# Altium schematic sheet 18_HDMI_Connector.SchDoc
size A3; SheetNumber: 18; SheetTotal: 21
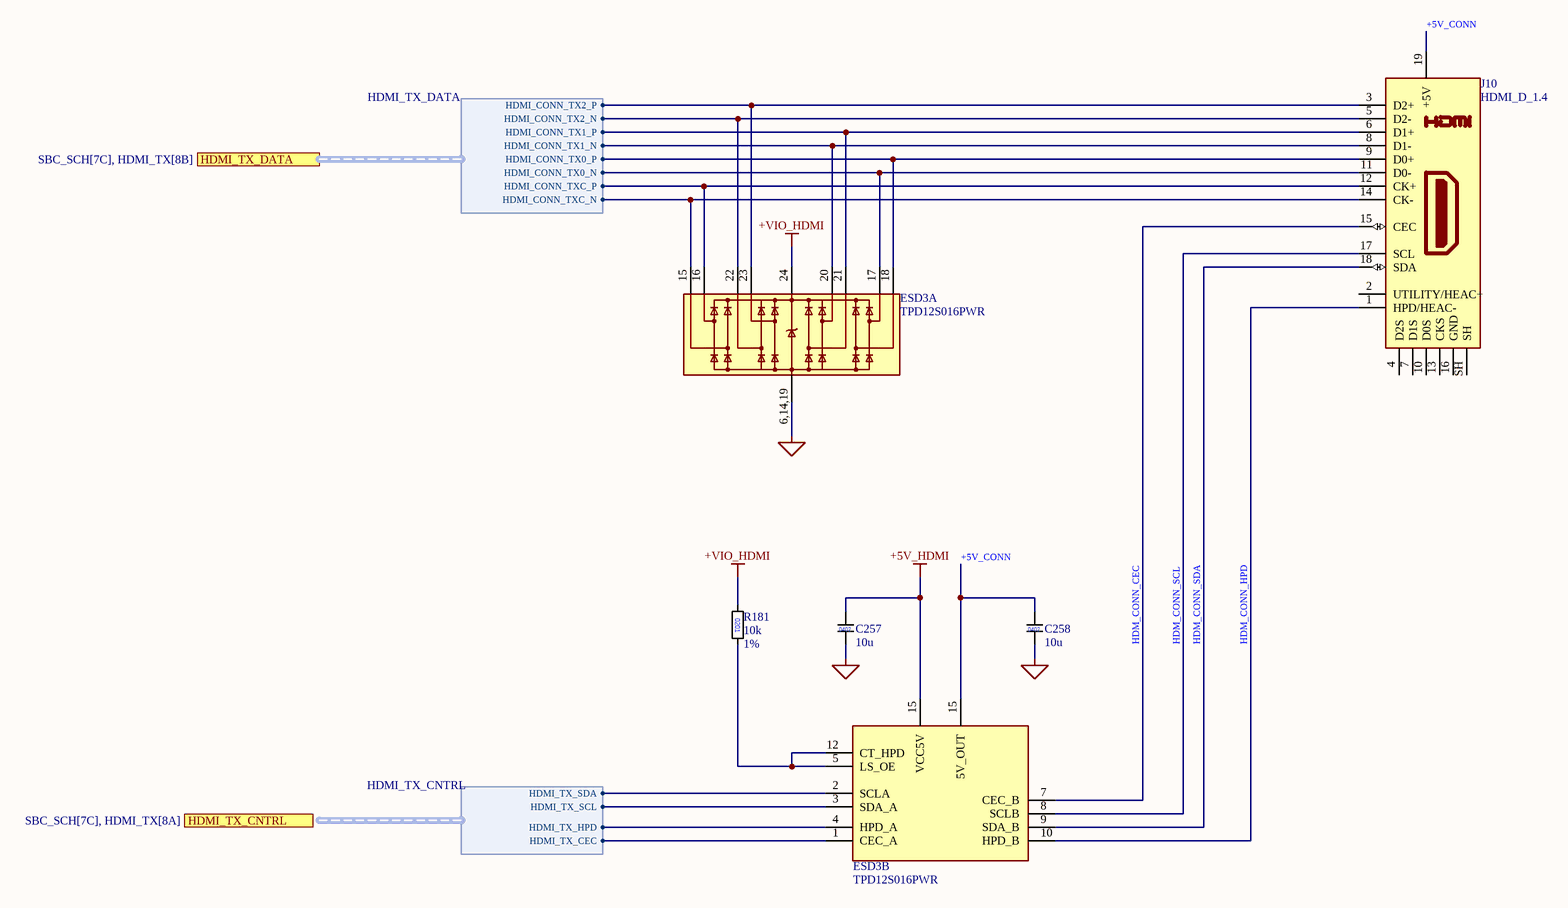
[diagram p0: 18_HDMI_Connector.SchDoc]

## Parts
C257  value 10u  [C0402]  (hidden comment: 4u7)
C258  value 10u  [C0402]  (hidden comment: 4u7)
ESD3  TPD12S016PWR  [TSOP65P640X120-24N]  (parts A,B of 2)
J10  HDMI_D_1.4  [HDMI_Micro-D_Molex_46765-1xxx]
R181  value 10k  Tolerance: 1%  [R0201]  (hidden comment: 0201)

## Ports
HDMI_TX_CNTRL (harness HDMI_TX_CNTRL, see SBC_SCH[7C], HDMI_TX[8A]), HDMI_TX_DATA (harness HDMI_TX_DATA, see SBC_SCH[7C], HDMI_TX[8B])

## Harnesses
HDMI_TX_DATA: HDMI_CONN_TXC_P, HDMI_CONN_TXC_N, HDMI_CONN_TX0_P, HDMI_CONN_TX0_N, HDMI_CONN_TX1_P, HDMI_CONN_TX1_N, HDMI_CONN_TX2_P, HDMI_CONN_TX2_N
HDMI_TX_CNTRL: HDMI_TX_SDA, HDMI_TX_SCL, HDMI_TX_HPD, HDMI_TX_CEC

## Nets
+5V_HDMI: C257.1 ESD3.15(VCC5V)
+VIO_HDMI: ESD3.24(VCCA) R181.1
GND: C257.2 C258.2 ESD3.6,14,19(GND)
+5V_CONN: C258.1 ESD3.15(5V_OUT) J10.19(+5V)
HDM_CONN_CEC: ESD3.7(CEC_B) J10.15(CEC)
HDM_CONN_HPD: ESD3.10(HPD_B) J10.1(HPD/HEAC-)
HDM_CONN_SCL: ESD3.8(SCLB) J10.17(SCL)
HDM_CONN_SDA: ESD3.9(SDA_B) J10.18(SDA)
NetESD3_1: ESD3.1(CEC_A) ; harness HDMI_TX_CNTRL.HDMI_TX_CEC
NetESD3_2: ESD3.2(SCLA) ; harness HDMI_TX_CNTRL.HDMI_TX_SDA
NetESD3_3: ESD3.3(SDA_A) ; harness HDMI_TX_CNTRL.HDMI_TX_SCL
NetESD3_4: ESD3.4(HPD_A) ; harness HDMI_TX_CNTRL.HDMI_TX_HPD
NetESD3_5: ESD3.5(LS_OE) ESD3.12(CT_HPD) R181.2
NetESD3_15: ESD3.15(CLK-) J10.14(CK-) ; port HDMI_TX_DATA.HDMI_CONN_TXC_N
NetESD3_16: ESD3.16(CLK+) J10.12(CK+) ; port HDMI_TX_DATA.HDMI_CONN_TXC_P
NetESD3_17: ESD3.17(D0-) J10.11(D0-) ; port HDMI_TX_DATA.HDMI_CONN_TX0_N
NetESD3_18: ESD3.18(D0+) J10.9(D0+) ; port HDMI_TX_DATA.HDMI_CONN_TX0_P
NetESD3_20: ESD3.20(D1-) J10.8(D1-) ; port HDMI_TX_DATA.HDMI_CONN_TX1_N
NetESD3_21: ESD3.21(D1+) J10.6(D1+) ; port HDMI_TX_DATA.HDMI_CONN_TX1_P
NetESD3_22: ESD3.22(D2-) J10.5(D2-) ; port HDMI_TX_DATA.HDMI_CONN_TX2_N
NetESD3_23: ESD3.23(D2+) J10.3(D2+) ; port HDMI_TX_DATA.HDMI_CONN_TX2_P

Not connected (* = marked no-connect by the designer): J10 2(UTILITY/HEAC+) 4(D2S) 7(D1S) 10(D0S) 13(CKS) 16(GND) SH

## Notes on the sheet
- (in symbol C_0402) 0402

## Library data of the parts
C257 C258 = C_0402: MLCC 0402; Manufacturer_Name: *; Manufacturer_Part_Number: *
ESD3 = TPD12S016PWR: HDMI TSSOP-24 Interface 3.4Gbps 4.5V~5.5V I2C; Manufacturer_Name: Texas Instrument; Manufacturer_Part_Number: TPD12S016PWR; Value: TPD12S016PWR
J10 = HDMI_D_1.4: HDMI 1.4+ type D connector; Datasheet: http://pinoutguide.com/PortableDevices/micro_hdmi_type_d_pinout.shtml; ComponentLink1Description: Datasheet; ComponentLink1URL: http://pinoutguide.com/PortableDevices/micro_hdmi_type_d_pinout.shtml
R181 = R_0201: Manufacturer_Name: *; Manufacturer_Part_Number: *